# Altium schematic sheet Diff_Amplifier_Sheet.SchDoc
size A4; DocumentNumber: 11; SheetNumber: 11; SheetTotal: 11
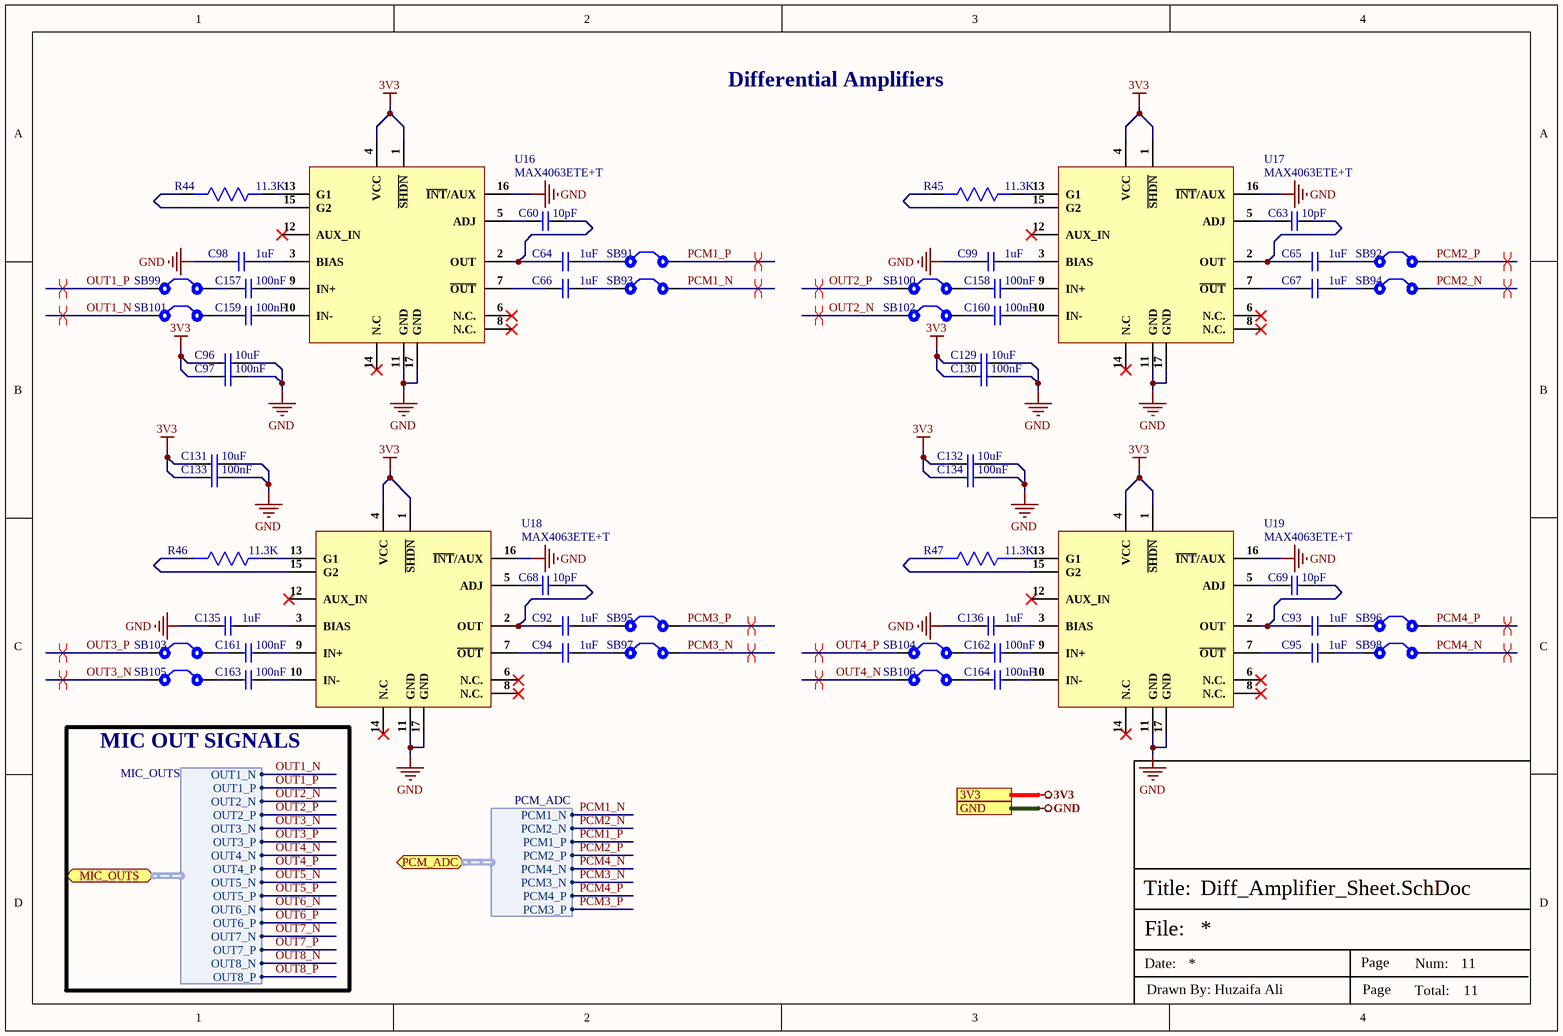
[diagram p0: Diff_Amplifier_Sheet.SchDoc]

## Parts
C60  10pF  [Cap-0603]
C63  10pF  [Cap-0603]
C64  1uF  [Cap-0402]
C65  1uF  [Cap-0402]
C66  1uF  [Cap-0402]
C67  1uF  [Cap-0402]
C68  10pF  [Cap-0603]
C69  10pF  [Cap-0603]
C92  1uF  [Cap-0402]
C93  1uF  [Cap-0402]
C94  1uF  [Cap-0402]
C95  1uF  [Cap-0402]
C96  10uF  [Cap-0603]
C97  100nF  [Cap-0402]
C98  1uF  [Cap-0402]
C99  1uF  [Cap-0402]
C129  10uF  [Cap-0603]
C130  100nF  [Cap-0402]
C131  10uF  [Cap-0603]
C132  10uF  [Cap-0603]
C133  100nF  [Cap-0402]
C134  100nF  [Cap-0402]
C135  1uF  [Cap-0402]
C136  1uF  [Cap-0402]
C157  100nF  [Cap-0402]
C158  100nF  [Cap-0402]
C159  100nF  [Cap-0402]
C160  100nF  [Cap-0402]
C161  100nF  [Cap-0402]
C162  100nF  [Cap-0402]
C163  100nF  [Cap-0402]
C164  100nF  [Cap-0402]
R44  11.3K  [Res-0603]
R45  11.3K  [Res-0603]
R46  11.3K  [Res-0603]
R47  11.3K  [Res-0603]
SB91  Solder Bridge  [Solder Bridge]  (value not drawn)
SB92  Solder Bridge  [Solder Bridge]  (value not drawn)
SB93  Solder Bridge  [Solder Bridge]  (value not drawn)
SB94  Solder Bridge  [Solder Bridge]  (value not drawn)
SB95  Solder Bridge  [Solder Bridge]  (value not drawn)
SB96  Solder Bridge  [Solder Bridge]  (value not drawn)
SB97  Solder Bridge  [Solder Bridge]  (value not drawn)
SB98  Solder Bridge  [Solder Bridge]  (value not drawn)
SB99  Solder Bridge  [Solder Bridge]  (value not drawn)
SB100  Solder Bridge  [Solder Bridge]  (value not drawn)
SB101  Solder Bridge  [Solder Bridge]  (value not drawn)
SB102  Solder Bridge  [Solder Bridge]  (value not drawn)
SB103  Solder Bridge  [Solder Bridge]  (value not drawn)
SB104  Solder Bridge  [Solder Bridge]  (value not drawn)
SB105  Solder Bridge  [Solder Bridge]  (value not drawn)
SB106  Solder Bridge  [Solder Bridge]  (value not drawn)
U16  MAX4063ETE+T  [16-TQFN (4x4)]
U17  MAX4063ETE+T  [16-TQFN (4x4)]
U18  MAX4063ETE+T  [16-TQFN (4x4)]
U19  MAX4063ETE+T  [16-TQFN (4x4)]

## Ports
3V3, GND, MIC_OUTS (bidir, harness MIC_OUTS), PCM_ADC (bidir, harness PCM_ADC)

## Harnesses
MIC_OUTS: OUT1_N, OUT1_P, OUT2_N, OUT2_P, OUT3_N, OUT3_P, OUT4_N, OUT4_P, OUT5_N, OUT5_P, OUT6_N, OUT6_P, OUT7_N, OUT7_P, OUT8_N, OUT8_P
PCM_ADC: PCM1_N, PCM2_N, PCM1_P, PCM2_P, PCM4_N, PCM3_N, PCM4_P, PCM3_P

## Nets
3V3: C96.1 C97.1 C129.1 C130.1 C131.1 C132.1 C133.1 C134.1 U16.1(~{SHDN}) U16.4(VCC) U17.1(~{SHDN}) U17.4(VCC) U18.1(~{SHDN}) U18.4(VCC) U19.1(~{SHDN}) U19.4(VCC) ; port 3V3
GND: C96.2 C97.2 C98.1 C99.1 C129.2 C130.2 C131.2 C132.2 C133.2 C134.2 C135.1 C136.1 U16.11(GND) U16.16(~{INT}/AUX) U16.17(GND) U17.11(GND) U17.16(~{INT}/AUX) U17.17(GND) U18.11(GND) U18.16(~{INT}/AUX) U18.17(GND) U19.11(GND) U19.16(~{INT}/AUX) U19.17(GND) ; port GND
OUT1_N: SB101.1 ; port MIC_OUTS.OUT1_N
OUT1_P: SB99.1 ; port MIC_OUTS.OUT1_P
OUT2_N: SB102.1 ; port MIC_OUTS.OUT2_N
OUT2_P: SB100.1 ; port MIC_OUTS.OUT2_P
OUT3_N: SB105.1 ; port MIC_OUTS.OUT3_N
OUT3_P: SB103.1 ; port MIC_OUTS.OUT3_P
OUT4_N: SB106.1 ; port MIC_OUTS.OUT4_N
OUT4_P: SB104.1 ; port MIC_OUTS.OUT4_P
OUT5_N: port MIC_OUTS.OUT5_N
OUT5_P: port MIC_OUTS.OUT5_P
OUT6_N: port MIC_OUTS.OUT6_N
OUT6_P: port MIC_OUTS.OUT6_P
OUT7_N: port MIC_OUTS.OUT7_N
OUT7_P: port MIC_OUTS.OUT7_P
OUT8_N: port MIC_OUTS.OUT8_N
OUT8_P: port MIC_OUTS.OUT8_P
PCM1_N: SB93.2 ; port PCM_ADC.PCM1_N
PCM1_P: SB91.2 ; port PCM_ADC.PCM1_P
PCM2_N: SB94.2 ; port PCM_ADC.PCM2_N
PCM2_P: SB92.2 ; port PCM_ADC.PCM2_P
PCM3_N: SB97.2 ; port PCM_ADC.PCM3_N
PCM3_P: SB95.2 ; port PCM_ADC.PCM3_P
PCM4_N: SB98.2 ; port PCM_ADC.PCM4_N
PCM4_P: SB96.2 ; port PCM_ADC.PCM4_P
NetC60_1: C60.1 U16.5(ADJ)
NetC60_2: C60.2 C64.1 U16.2(OUT)
NetC63_1: C63.1 U17.5(ADJ)
NetC63_2: C63.2 C65.1 U17.2(OUT)
NetC64_2: C64.2 SB91.1
NetC65_2: C65.2 SB92.1
NetC66_1: C66.1 U16.7(~{OUT})
NetC66_2: C66.2 SB93.1
NetC67_1: C67.1 U17.7(~{OUT})
NetC67_2: C67.2 SB94.1
NetC68_1: C68.1 U18.5(ADJ)
NetC68_2: C68.2 C92.1 U18.2(OUT)
NetC69_1: C69.1 U19.5(ADJ)
NetC69_2: C69.2 C93.1 U19.2(OUT)
NetC92_2: C92.2 SB95.1
NetC93_2: C93.2 SB96.1
NetC94_1: C94.1 U18.7(~{OUT})
NetC94_2: C94.2 SB97.1
NetC95_1: C95.1 U19.7(~{OUT})
NetC95_2: C95.2 SB98.1
NetC98_2: C98.2 U16.3(BIAS)
NetC99_2: C99.2 U17.3(BIAS)
NetC135_2: C135.2 U18.3(BIAS)
NetC136_2: C136.2 U19.3(BIAS)
NetC157_1: C157.1 SB99.2
NetC157_2: C157.2 U16.9(IN+)
NetC158_1: C158.1 SB100.2
NetC158_2: C158.2 U17.9(IN+)
NetC159_1: C159.1 SB101.2
NetC159_2: C159.2 U16.10(IN-)
NetC160_1: C160.1 SB102.2
NetC160_2: C160.2 U17.10(IN-)
NetC161_1: C161.1 SB103.2
NetC161_2: C161.2 U18.9(IN+)
NetC162_1: C162.1 SB104.2
NetC162_2: C162.2 U19.9(IN+)
NetC163_1: C163.1 SB105.2
NetC163_2: C163.2 U18.10(IN-)
NetC164_1: C164.1 SB106.2
NetC164_2: C164.2 U19.10(IN-)
NetR44_1: R44.1 U16.13(G1)
NetR44_2: R44.2 U16.15(G2)
NetR45_1: R45.1 U17.13(G1)
NetR45_2: R45.2 U17.15(G2)
NetR46_1: R46.1 U18.13(G1)
NetR46_2: R46.2 U18.15(G2)
NetR47_1: R47.1 U19.13(G1)
NetR47_2: R47.2 U19.15(G2)

Not connected (* = marked no-connect by the designer): U16 6(N.C.)* 8(N.C.)* 12(AUX_IN)* 14(N.C)*; U17 6(N.C.)* 8(N.C.)* 12(AUX_IN)* 14(N.C)*; U18 6(N.C.)* 8(N.C.)* 12(AUX_IN)* 14(N.C)*; U19 6(N.C.)* 8(N.C.)* 12(AUX_IN)* 14(N.C)*

## Layout directives
differential pair; net class OUT1; differential pair class OUT1_Lines: OUT1_N, OUT1_P
differential pair; net class OUT3; differential pair class OUT3_Lines: OUT3_N, OUT3_P
differential pair; net class PCM3; differential pair class PCM3_Lines: PCM3_N, PCM3_P
differential pair; net class OUT4; differential pair class OUT4_Lines: OUT4_N, OUT4_P
differential pair; net class PCM4; differential pair class PCM4_Lines: PCM4_N, PCM4_P
differential pair; net class PCM1; differential pair class PCM1_Lines: PCM1_N, PCM1_P
differential pair; net class OUT2; differential pair class OUT2_Lines: OUT2_N, OUT2_P
differential pair; net class PCM2; differential pair class PCM2_Lines: PCM2_N, PCM2_P

## Notes on the sheet
- Differential Amplifiers
- MIC OUT SIGNALS
- File:
- Title:
- Date:
- Page
- Num:
- Total:
- Drawn By: Huzaifa Ali

## Library data of the parts
C60 C63 C68 C69 = CC0603JRNPO9BN100: CAP CER 10PF 50V C0G/NPO 0603; Manufacturer: Yageo; Tolerance: 5%; Dielectric: C0G; Temperature Coefficient: 30ppm/°C; Insulation Resistance: 100GR; ComponentLink1URL: https://datasheet.ciiva.com/25787/cl10a475ka8nqnc-25787017.pdf?src-supplier=Digi-Key; ComponentLink1Description: https://datasheet.ciiva.com/25787/cl10a475ka8nqnc-25787017.pdf?src-supplier=Digi-Key; ComponentLink2URL: https://datasheet.ciiva.com/144/mlccorderingcode-144651.pdf?src-supplier=Digi-Key; ComponentLink2Description: https://datasheet.ciiva.com/144/mlccorderingcode-144651.pdf?src-supplier=Digi-Key; ComponentLink3URL: https://datasheet.ciiva.com/11786/0900766b8079c870-11786407.pdf?src-supplier=RSComponents; ComponentLink3Description: https://datasheet.ciiva.com/11786/0900766b8079c870-11786407.pdf?src-supplier=RSComponents; ComponentLink4URL: https://datasheet.ciiva.com/5789/1734582-5789616.pdf?src-supplier=Farnell; ComponentLink4Description: https://datasheet.ciiva.com/5789/1734582-5789616.pdf?src-supplier=Farnell; ComponentLink5URL: https://datasheet.ciiva.com/26862/getdatasheetpartid-403524-26862758.pdf?src-supplier=Verical; ComponentLink5Description: https://datasheet.ciiva.com/26862/getdatasheetpartid-403524-26862758.pdf?src-supplier=Verical; ComponentLink6URL: https://datasheet.ciiva.com/7978/1132289-7978126.pdf?src-supplier=Element14; ComponentLink6Description: https://datasheet.ciiva.com/7978/1132289-7978126.pdf?src-supplier=Element14; ComponentLink7URL: https://datasheet.ciiva.com/46430/1835847-46430150.pdf?src-supplier=Element14; ComponentLink7Description: https://datasheet.ciiva.com/46430/1835847-46430150.pdf?src-supplier=Element14; ComponentLink8URL: https://datasheet.ciiva.com/144/mlccorderingcode-144650.pdf?src-supplier=Digi-Key; ComponentLink8Description: https://datasheet.ciiva.com/144/mlccorderingcode-144650.pdf?src-supplier=Digi-Key; ComponentLink9URL: https://datasheet.ciiva.com/144/mlccorderingcode-144649.pdf?src-supplier=Digi-Key; ComponentLink9Description: https://datasheet.ciiva.com/144/mlccorderingcode-144649.pdf?src-supplier=Digi-Key; ComponentLink10URL: https://datasheet.ciiva.com/5425/upy-gp-np0-16v-to-50v-8-5425564.pdf?src-supplier=Mouser; ComponentLink10Description: https://datasheet.ciiva.com/5425/upy-gp-np0-16v-to-50v-8-5425564.pdf?src-supplier=Mouser; ComponentLink11URL: https://datasheet.ciiva.com/8033/1734582-8033710.pdf?src-supplier=Element14; ComponentLink11Description: https://datasheet.ciiva.com/8033/1734582-8033710.pdf?src-supplier=Element14; ComponentLink12URL: https://datasheet.ciiva.com/8033/1734582-8033706.pdf?src-supplier=Element14; ComponentLink12Description: https://datasheet.ciiva.com/8033/1734582-8033706.pdf?src-supplier=Element14; Supplier 1: Digi-Key; Manufacturer Part Number: CC0603JRNPO9BN100; RoHS: Yes; Category: Ceramic Capacitors; Stock 1: 1700978; Pricing 1: 1=0.10000, 10=0.03900, 50=0.02120, 100=0.01740, 500=0.01240, 1000=0.00974 (USD); Mount: Surface Mount; Case/Package: 0603; Number of Pins: 2; Case Code (Metric): 1608; Case Code (Imperial): 0603; Min Operating Temperature: -55°C; Max Operating Temperature: 125°C; Capacitance: 10pF; Voltage: 50V; Voltage Rating: 50V; Voltage Rating (DC): 50V; Packaging: Tape and Reel; Package Quantity: 1; Termination: SMD/SMT; Resistor Type: Ceramic; Series: CC; Length: 1.6mm; Width: 0.031inch; Height: 0.8mm; Thickness: 0.035inch; Depth: 0.8mm; Radiation Hardening: No; RoHS Compliant: Yes; REACH SVHC: No SVHC; Lead Free: Lead Free; Supplier Part Number 1: 311-1058-1-ND; LCSC Part Number: C106245
C64-C67 C92-C95 C98 C99 C135 C136 = CC0402KRX5R8BB105: CAP CER 1UF 25V X5R 0402; Manufacturer: Yageo; Tolerance: 10%; Supplier 1: Mouser; Manufacturer Part Number: CC0402KRX5R8BB105; RoHS: Yes; Category: Ceramic Capacitors; Stock 1: 91975; Pricing 1: 1=0.30000, 10=0.20400, 50=0.20400, 100=0.11600, 1000=0.07200, 10000=0.05900 (USD); Mount: Surface Mount; Case/Package: 0402; Case Code (Metric): 1005; Case Code (Imperial): 0402; Weight: 2.3E-05oz; Min Operating Temperature: -55°C; Max Operating Temperature: 85°C; Packaging: Tape and Reel; Capacitance: 1uF; Voltage Rating: 25V; Dielectric: X5R; Termination: SMD/SMT; Voltage Rating (DC): 25V; Package Quantity: 10000; Length: 0.039inch; Width: 0.02inch; Thickness: 0.022inch; Lead Free: Lead Free; Halogen Free: Halogen Free; RoHS Compliant: Yes; ComponentLink1URL: http://www.mouser.com/ds/2/447/Yageo_UPY-GP_NP0_16V-to-50V_9-358835.pdf?src-supplier=Mouser; ComponentLink1Description: http://www.mouser.com/ds/2/447/Yageo_UPY-GP_NP0_16V-to-50V_9-358835.pdf?src-supplier=Mouser; ComponentLink2URL: http://www.yageo.com/documents/recent/UPY-GPHC_X5R_4V-to-50V_25.pdf?src-supplier=Digi-Key; ComponentLink2Description: http://www.yageo.com/documents/recent/UPY-GPHC_X5R_4V-to-50V_25.pdf?src-supplier=Digi-Key; ComponentLink3URL: https://4donline.ihs.com/images/VipMasterIC/IC/YAGO/YAGO-S-A0006851646/YAGO-S-A0006851646-1.pdf?hkey=6D3A4C79FDBF58556ACFDE234799DDF0&src-supplier=Newark; ComponentLink3Description: https://4donline.ihs.com/images/VipMasterIC/IC/YAGO/YAGO-S-A0006851646/YAGO-S-A0006851646-1.pdf?hkey=6D3A4C79FDBF58556ACFDE234799DDF0&src-supplier=Newark; Supplier Part Number 1: 603-CC402KRX5R8BB105; LCSC Part Number: C326568
C96 C129 C131 C132 = C1608X5R1E106M080AC: CAP CER 10UF 25V X5R 0603; Manufacturer: TDK; Dielectric Material: Ceramic; Tolerance: 20%; Supplier 1: Digi-Key; Manufacturer Part Number: C1608X5R1E106M080AC; Stock 1: 61681; Pricing 1: 1=0.96, 10=0.704, 100=0.483, 500=0.38238, 1000=0.322 (USD); Mount: Surface Mount; Case/Package: 0603; Weight: 7.1E-05oz; Case Code (Imperial): 0603; Case Code (Metric): 1608; Min Operating Temperature: -55°C; Max Operating Temperature: 85°C; Capacitance: 10uF; Packaging: Tape and Reel; Voltage Rating: 25V; Voltage Rating (DC): 25V; Termination: SMD/SMT; Package Quantity: 1; Dielectric: X5R; Composition: Ceramic; Length: 1.6mm; Height: 0.8mm; Width: 0.8mm; Thickness: 0.039inch; Depth: 0.8mm; Lead Free: Lead Free; REACH SVHC: No SVHC; Supplier Part Number 1: 445-9015-1-ND; LCSC Part Number: C2168289
C97 C130 C133 C134 C157-C164 = CC0402KRX5R7BB104: CAP CER 0.1UF 16V X5R 0402; Manufacturer: Yageo; Tolerance: 10%; Supplier 1: Mouser; Manufacturer Part Number: CC0402KRX5R7BB104; RoHS: Yes; Category: Ceramic Capacitors; Stock 1: 936792; Pricing 1: 1=0.10000, 10=0.02300, 50=0.02300, 100=0.01100, 1000=0.00600, 10000=0.00400 (USD); Mount: Surface Mount; Case/Package: 0402; Number of Pins: 2; Case Code (Metric): 1005; Case Code (Imperial): 0402; Min Operating Temperature: -55°C; Max Operating Temperature: 85°C; Capacitance: 100nF; Dielectric: X5R; Packaging: Tape and Reel; Voltage Rating: 16V; Package Quantity: 1; Voltage Rating (DC): 16V; Termination: SMD/SMT; Resistor Type: Ceramic; Series: CC; Construction: Flat; Length: 1mm; Width: 0.02inch; Height: 0.5mm; Thickness: 0.022inch; Depth: 0.5mm; Radiation Hardening: No; REACH SVHC: Unknown; Lead Free: Lead Free; Halogen Free: Halogen Free; RoHS Compliant: Yes; ComponentLink1URL: https://datasheet.ciiva.com/155/mlccorderingcode-155879.pdf?src-supplier=Digi-Key; ComponentLink1Description: https://datasheet.ciiva.com/155/mlccorderingcode-155879.pdf?src-supplier=Digi-Key; ComponentLink2URL: https://datasheet.ciiva.com/155/mlccorderingcode-155878.pdf?src-supplier=Digi-Key; ComponentLink2Description: https://datasheet.ciiva.com/155/mlccorderingcode-155878.pdf?src-supplier=Digi-Key; ComponentLink3URL: https://datasheet.ciiva.com/155/mlccorderingcode-155880.pdf?src-supplier=Digi-Key; ComponentLink3Description: https://datasheet.ciiva.com/155/mlccorderingcode-155880.pdf?src-supplier=Digi-Key; ComponentLink4URL: https://datasheet.ciiva.com/11464/upy-gphc-x5r-4v-to-50v-12-11464869.pdf?src-supplier=Avnet; ComponentLink4Description: https://datasheet.ciiva.com/11464/upy-gphc-x5r-4v-to-50v-12-11464869.pdf?src-supplier=Avnet; Supplier Part Number 1: 603-CC402KRX5R7BB104; LCSC Part Number: C106204
R44-R47 = RC0603FR-0711K3L: RES 11.3K OHM 1% 1/10W 0603; Manufacturer: Yageo; Power Rating: 100mW; Temperature Coefficient: 100ppm/°C; Resistance: 11.3kR; Voltage Rating: 50V; Working Voltage: 75V; Item Type: Resistor; Supplier 1: Arrow Electronics; Manufacturer Part Number: RC0603FR-0711K3L; RoHS: Yes; Category: Chip SMD Resistors; Stock 1: 26; Pricing 1: 1=0.05080, 10=0.01610, 25=0.01080 (USD); Case/Package: 0603; Case Code (Imperial): 0603; Case Code (Metric): 1608; Min Operating Temperature: -55°C; Max Operating Temperature: 155°C; Tolerance: 1%; Series: RC; Technology: THICK FILM; Packaging: Tape and Reel; Package Quantity: 1; Termination: SMD/SMT; Resistor Type: Thick Film; Number of Terminations: 2; Max Power Dissipation: 100mW; Voltage Rating (DC): 50V; Features: Moisture Resistant; Construction: Rectangular; Length: 1.6mm; Width: 0.8mm; Height: 0.022inch; Depth: 0.8mm; RoHS Compliant: Yes; Military Standard: Not; Lead Free: Lead Free; ComponentLink1URL: https://datasheet.ciiva.com/2454/pyu-r-int-thick-7-2454634.pdf?src-supplier=Digi-Key; ComponentLink1Description: https://datasheet.ciiva.com/2454/pyu-r-int-thick-7-2454634.pdf?src-supplier=Digi-Key; ComponentLink2URL: https://datasheet.ciiva.com/2454/pyu-r-int-thick-7-2454635.pdf?src-supplier=Digi-Key; ComponentLink2Description: https://datasheet.ciiva.com/2454/pyu-r-int-thick-7-2454635.pdf?src-supplier=Digi-Key; ComponentLink3URL: https://datasheet.ciiva.com/2454/pyu-r-int-thick-7-2454633.pdf?src-supplier=Digi-Key; ComponentLink3Description: https://datasheet.ciiva.com/2454/pyu-r-int-thick-7-2454633.pdf?src-supplier=Digi-Key; ComponentLink4URL: https://datasheet.ciiva.com/12558/rc0603-272842-12558680.pdf?src-supplier=Mouser; ComponentLink4Description: https://datasheet.ciiva.com/12558/rc0603-272842-12558680.pdf?src-supplier=Mouser; ComponentLink5URL: https://datasheet.ciiva.com/15189/getdatasheetpartid-326472-15189596.pdf?src-supplier=Verical; ComponentLink5Description: https://datasheet.ciiva.com/15189/getdatasheetpartid-326472-15189596.pdf?src-supplier=Verical; Supplier Part Number 1: RC0603FR-0711K3L; LCSC Part Number: C137803
SB91-SB106 = Solder Bridge: Solder Bridge ON
U16-U19 = MAX4063ETE+T: IC AMP CLASS AB STEREO 16TQFN; Manufacturer: Maxim; Voltage Gain: 26.02dB; Min Supply Voltage: 2.4V; Max Supply Voltage: 5.5V; Power Supply Rejection Ratio (PSRR): 95dB; Supplier 1: Mouser; Manufacturer Part Number: MAX4063ETE+T; RoHS: Yes; Category: Amplifiers - Audio; Stock 1: 23845; Pricing 1: 1=1.88000, 10=1.70000, 50=1.60000, 100=1.37000, 1000=0.96000, 10000=0.92700 (USD); Mount: Surface Mount; Number of Pins: 16; Min Operating Temperature: -40°C; Max Operating Temperature: 85°C; Package Quantity: 2500; Packaging: Tape and Reel; Series: -; Radiation Hardening: No; RoHS Compliant: Yes; ComponentLink1URL: https://datasheet.ciiva.com/1792/max4063-1792007.pdf?src-supplier=Digi-Key; ComponentLink1Description: https://datasheet.ciiva.com/1792/max4063-1792007.pdf?src-supplier=Digi-Key; ComponentLink2URL: https://datasheet.ciiva.com/2968/max4063-2968783.pdf?src-supplier=Avnet; ComponentLink2Description: https://datasheet.ciiva.com/2968/max4063-2968783.pdf?src-supplier=Avnet; Supplier Part Number 1: 700-MAX4063ETET; LCSC Part Number: *; Item Type: IC